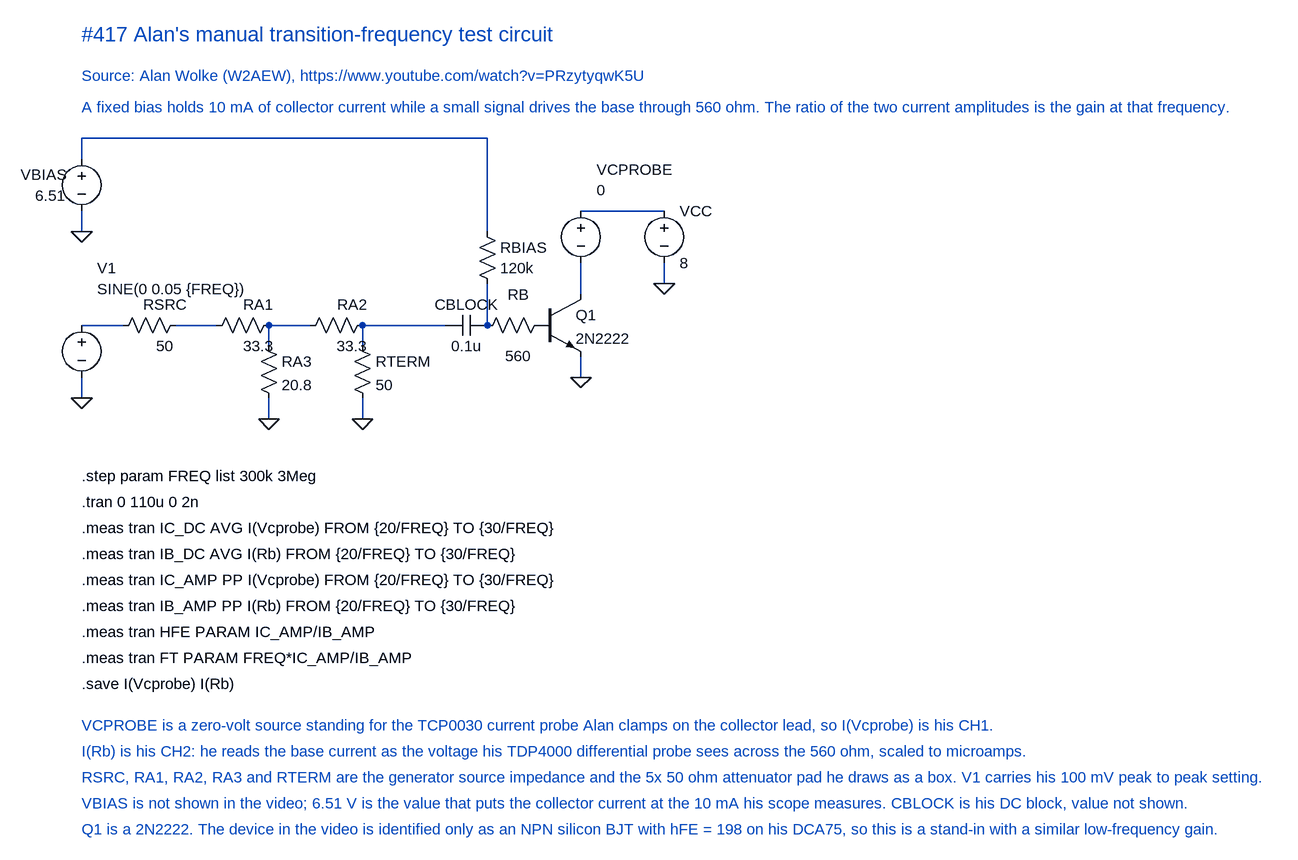
[diagram p0: schematic Manual fT test circuit.asc]
Manual fT test circuit.asc, the LTspice schematic file:
Version 4
SHEET 1 2400 1400
WIRE 96 80 96 112
WIRE 96 80 720 80
WIRE 96 192 96 224
WIRE 96 368 160 368
WIRE 96 448 96 480
WIRE 240 368 304 368
WIRE 384 368 448 368
WIRE 384 368 384 400
WIRE 384 480 384 512
WIRE 528 368 528 400
WIRE 528 368 656 368
WIRE 528 480 528 512
WIRE 720 80 720 224
WIRE 720 368 720 304
WIRE 864 320 864 272
WIRE 864 192 992 192
WIRE 864 416 864 448
WIRE 992 272 992 304
FLAG 96 224 0
FLAG 96 480 0
FLAG 384 512 0
FLAG 528 512 0
FLAG 864 448 0
FLAG 992 304 0
SYMBOL voltage 96 352 R0
WINDOW 0 24 -72 Left 2
WINDOW 3 24 -40 Left 2
SYMATTR InstName V1
SYMATTR Value SINE(0 0.05 {FREQ})
SYMBOL voltage 96 96 R0
WINDOW 0 -24 40 Right 2
WINDOW 3 -24 72 Right 2
SYMATTR InstName VBIAS
SYMATTR Value 6.51
SYMBOL res 256 352 R90
WINDOW 0 0 32 VBottom 2
WINDOW 3 32 32 VTop 2
SYMATTR InstName RSRC
SYMATTR Value 50
SYMBOL res 400 352 R90
WINDOW 0 0 32 VBottom 2
WINDOW 3 32 32 VTop 2
SYMATTR InstName RA1
SYMATTR Value 33.3
SYMBOL res 368 384 R0
SYMATTR InstName RA3
SYMATTR Value 20.8
SYMBOL res 544 352 R90
WINDOW 0 0 32 VBottom 2
WINDOW 3 32 32 VTop 2
SYMATTR InstName RA2
SYMATTR Value 33.3
SYMBOL res 512 384 R0
SYMATTR InstName RTERM
SYMATTR Value 50
SYMBOL cap 720 352 R90
WINDOW 0 0 32 VBottom 2
WINDOW 3 32 32 VTop 2
SYMATTR InstName CBLOCK
SYMATTR Value 0.1u
SYMBOL res 704 208 R0
WINDOW 0 36 40 Left 2
WINDOW 3 36 72 Left 2
SYMATTR InstName RBIAS
SYMATTR Value 120k
SYMBOL res 704 384 R270
WINDOW 0 48 64 VTop 2
WINDOW 3 -16 64 VBottom 2
SYMATTR InstName RB
SYMATTR Value 560
SYMBOL npn 800 320 R0
SYMATTR InstName Q1
SYMATTR Value 2N2222
SYMBOL voltage 864 176 R0
WINDOW 0 24 -48 Left 2
WINDOW 3 24 -16 Left 2
SYMATTR InstName VCPROBE
SYMATTR Value 0
SYMBOL voltage 992 176 R0
SYMATTR InstName VCC
SYMATTR Value 8
TEXT 96 -80 Left 3 ;#417 Alan's manual transition-frequency test circuit
TEXT 96 -16 Left 2 ;Source: Alan Wolke (W2AEW), https://www.youtube.com/watch?v=PRzytyqwK5U
TEXT 96 32 Left 2 ;A fixed bias holds 10 mA of collector current while a small signal drives the base through 560 ohm. The ratio of the two current amplitudes is the gain at that frequency.
TEXT 96 600 Left 2 !.step param FREQ list 300k 3Meg
TEXT 96 640 Left 2 !.tran 0 110u 0 2n
TEXT 96 680 Left 2 !.meas tran IC_DC AVG I(Vcprobe) FROM {20/FREQ} TO {30/FREQ}
TEXT 96 720 Left 2 !.meas tran IB_DC AVG I(Rb) FROM {20/FREQ} TO {30/FREQ}
TEXT 96 760 Left 2 !.meas tran IC_AMP PP I(Vcprobe) FROM {20/FREQ} TO {30/FREQ}
TEXT 96 800 Left 2 !.meas tran IB_AMP PP I(Rb) FROM {20/FREQ} TO {30/FREQ}
TEXT 96 840 Left 2 !.meas tran HFE PARAM IC_AMP/IB_AMP
TEXT 96 880 Left 2 !.meas tran FT PARAM FREQ*IC_AMP/IB_AMP
TEXT 96 920 Left 2 !.save I(Vcprobe) I(Rb)
TEXT 96 984 Left 2 ;VCPROBE is a zero-volt source standing for the TCP0030 current probe Alan clamps on the collector lead, so I(Vcprobe) is his CH1.
TEXT 96 1024 Left 2 ;I(Rb) is his CH2: he reads the base current as the voltage his TDP4000 differential probe sees across the 560 ohm, scaled to microamps.
TEXT 96 1064 Left 2 ;RSRC, RA1, RA2, RA3 and RTERM are the generator source impedance and the 5x 50 ohm attenuator pad he draws as a box. V1 carries his 100 mV peak to peak setting.
TEXT 96 1104 Left 2 ;VBIAS is not shown in the video; 6.51 V is the value that puts the collector current at the 10 mA his scope measures. CBLOCK is his DC block, value not shown.
TEXT 96 1144 Left 2 ;Q1 is a 2N2222. The device in the video is identified only as an NPN silicon BJT with hFE = 198 on his DCA75, so this is a stand-in with a similar low-frequency gain.

The netlist it stands for:
* Manual fT test circuit.asc
V1 N002 0 SINE(0 0.05 {FREQ})
VBIAS N001 0 6.51
RSRC N003 N002 50
RA1 N004 N003 33.3
RA3 N004 0 20.8
RA2 N005 N004 33.3
RTERM N005 0 50
CBLOCK N006 N005 0.1u
RBIAS N001 N006 120k
RB N006 P001 560
Q1 N007 P001 0 0 2N2222
VCPROBE N008 N007 0
VCC N008 0 8
.model NPN NPN
.model PNP PNP
.lib standard.bjt
* #417 Alan's manual transition-frequency test circuit
* Source: Alan Wolke (W2AEW), https://www.youtube.com/watch?v=PRzytyqwK5U
* A fixed bias holds 10 mA of collector current while a small signal drives the base through 560 ohm. The ratio of the two current amplitudes is the gain at that frequency.
.step param FREQ list 300k 3Meg
.tran 0 110u 0 2n
.meas tran IC_DC AVG I(Vcprobe) FROM {20/FREQ} TO {30/FREQ}
.meas tran IB_DC AVG I(Rb) FROM {20/FREQ} TO {30/FREQ}
.meas tran IC_AMP PP I(Vcprobe) FROM {20/FREQ} TO {30/FREQ}
.meas tran IB_AMP PP I(Rb) FROM {20/FREQ} TO {30/FREQ}
.meas tran HFE PARAM IC_AMP/IB_AMP
.meas tran FT PARAM FREQ*IC_AMP/IB_AMP
.save I(Vcprobe) I(Rb)
* VCPROBE is a zero-volt source standing for the TCP0030 current probe Alan clamps on the collector lead, so I(Vcprobe) is his CH1.
* I(Rb) is his CH2: he reads the base current as the voltage his TDP4000 differential probe sees across the 560 ohm, scaled to microamps.
* RSRC, RA1, RA2, RA3 and RTERM are the generator source impedance and the 5x 50 ohm attenuator pad he draws as a box. V1 carries his 100 mV peak to peak setting.
* VBIAS is not shown in the video; 6.51 V is the value that puts the collector current at the 10 mA his scope measures. CBLOCK is his DC block, value not shown.
* Q1 is a 2N2222. The device in the video is identified only as an NPN silicon BJT with hFE = 198 on his DCA75, so this is a stand-in with a similar low-frequency gain.
.backanno
.end